# Altium schematic sheet signal-light-10.SchDoc
size A4; SheetNumber: 13; SheetTotal: 21
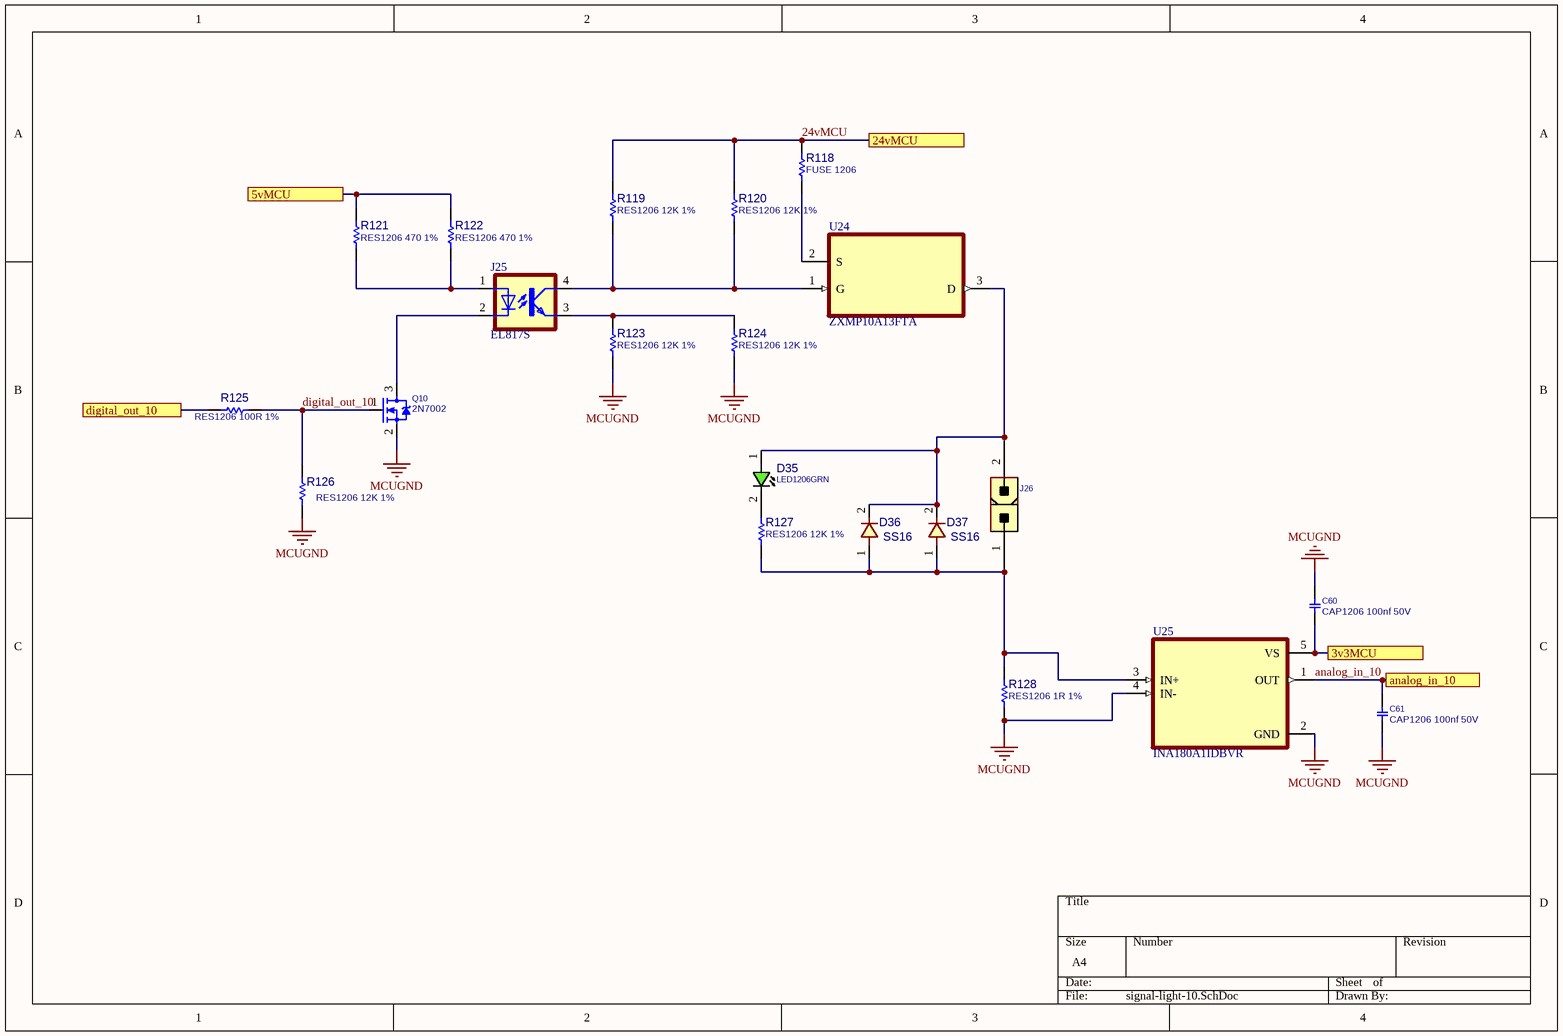
[diagram p0: signal-light-10.SchDoc]

## Parts
C60  CAP1206 100nf 50V  [C1206]
C61  CAP1206 100nf 50V  [C1206]
D35  LED1206GRN  [LED1206GRN]
D36  SS16  [D_SMA]
D37  SS16  [D_SMA]
J25  EL817S  [SOIC254P1030X460-4N]
J26  CONN_ATXPWR_2  [ATXPWR_2]  (value not drawn)
Q10  2N7002  [SOT23_3]
R118  FUSE 1206  [R1206]
R119  RES1206 12K 1%  [R1206]
R120  RES1206 12K 1%  [R1206]
R121  RES1206 470 1%  [R1206]
R122  RES1206 470 1%  [R1206]
R123  RES1206 12K 1%  [R1206]
R124  RES1206 12K 1%  [R1206]
R125  RES1206 100R 1%  [R1206]
R126  RES1206 12K 1%  [R1206]
R127  RES1206 12K 1%  [R1206]
R128  RES1206 1R 1%  [R1206]
U24  ZXMP10A13FTA  [SOT95P230X110-3N]
U25  INA180A1IDBVR  [SOT95P280X145-5N]

## Ports
3v3MCU, 5vMCU, 24vMCU, analog_in_10, digital_out_10

## Nets
MCUGND: C60.1 C61.2 Q10.2(SOURCE) R123.2 R124.2 R126.2 R128.2 U25.2(GND) U25.4(IN-)
3v3MCU: C60.2 U25.5(VS) ; port 3v3MCU
5vMCU: R121.2 R122.2 ; port 5vMCU
24vMCU: R118.1 R119.1 R120.1 ; port 24vMCU
analog_in_10: C61.1 U25.1(OUT) ; port analog_in_10
digital_out_10: Q10.1(GATE) R125.2 R126.1
digital_out_10: R125.1 ; port digital_out_10  [a separate net that carries the same name]
NetD35_1: D35.1(ANODE) D36.2 D37.2 J26.2 U24.3(D)
NetD35_2: D35.2(CATHODE) R127.1
NetD36_1: D36.1 D37.1 J26.1 R127.2 R128.1 U25.3(IN+)
NetJ25_1: J25.1(A) R121.1 R122.1
NetJ25_2: J25.2(C) Q10.3(DRAIN)
NetJ25_3: J25.3(EMIT) R123.1 R124.1
NetJ25_4: J25.4(COL) R119.2 R120.2 U24.1(G)
NetR118_2: R118.2 U24.2(S)

## Library data of the parts
C60 C61 = CAP_SMD_MLCC_1206: CAP, MLCC; PARAM: -, -%; MANF_P#: MANF_PART#; PARAM2: -V; PRICE: 100= 1$; MANF: -; ASSEMBLY: ASSEMBLY
D35 = LED_SMD_1206_GRN: LED, SMD, 1206, GREEN; PARAM: 20mA; DESC: DESCRIPTION; PARAM2: 2.2V; MANF: -; ASSEMBLY: ASSEMBLY; PRICE: 36t@Javan; MANF_P#: -; VALUE: LED1206GRN; MountType: SMT; PartType: LED
D36 D37 = DIODE_SMD_1N4001: DIODE, GENERAL PURPOSE, 50V/1A; DESC: DESCRIPTION; PARAM: 50V VRRM; PARAM2: 1A; MANF_P#: 1N4001; MANF: MANF; ASSEMBLY: ASSEMBLY; PRICE: PRICE; VALUE: SS16
J25 = EL817S: Optoisolator Transistor Output 5000Vrms 1 Channel 4-SMD; MF: Everlight Electronics; SnapEDA_Link: https://www.snapeda.com/parts/EL817S/Everlight+Electronics+Co+Ltd/view-part/?ref=snap; Package: SMD-4 Everlight Electronics Co Ltd; Value: *; MP: EL817S; Check_prices: https://www.snapeda.com/parts/EL817S/Everlight+Electronics+Co+Ltd/view-part/?ref=eda
J26 = CONN_ATXPWR_2: CONN, ATX POWER, 2 P; MANF: Molex; MANF_P#: 39281023; VALUE: CONN_ATXPWR_2; MountType: THD; PACKAGE: ATXPWR-2pin; Part Type: Conn.
Q10 = MOSN_2N7002_SOT23: MOSFET, N-CH, 60V, 0.3A; MANF: NXP; ASSEMBLY: ASSEMBLY; MANF_P#: 2N7002; PARAM2: 60v; PARAM: 0.3A; PRICE: 0.3t@Javan; VALUE: 2N7002
R118-R128 = RES_SMD_1206: RESISTOR, SMD; PARAM: 1%, 0.25W; DESC: DESCRIPTION; DIST#: MOUSER; MANF_P#: -; MANF: -; ASSEMBLY: ASSEMBLY; PRICE: -; PARAM2: -
U24 = ZXMP10A13FTA: P-Channel 100 V 600mA (Ta) 625mW (Ta) Surface Mount SOT-23-3; MF: Diodes Inc.; Purchase-URL: https://pricing.snapeda.com/search/part/ZXMP10A13FTA/?ref=eda; Package: SOT-23-3 Diodes Inc.; SnapEDA_Link: https://www.snapeda.com/parts/ZXMP10A13FTA/Diodes+Inc./view-part/?ref=snap; Availability: In Stock; Value: *; MP: ZXMP10A13FTA; Check_prices: https://www.snapeda.com/parts/ZXMP10A13FTA/Diodes+Inc./view-part/?ref=eda; Price: None
U25 = INA180A1IDBVR: 26V, 350kHz current sense amplifier; MF: Texas Instruments; SnapEDA_Link: https://www.snapeda.com/parts/INA180A1IDBVR/Texas+Instruments/view-part/?ref=snap; Package: SOT-23-5 Texas Instruments; Value: *; MP: INA180A1IDBVR; Check_prices: https://www.snapeda.com/parts/INA180A1IDBVR/Texas+Instruments/view-part/?ref=eda